# Altium project GESTUREDCONTROLCAR_PCB.PrjPcb
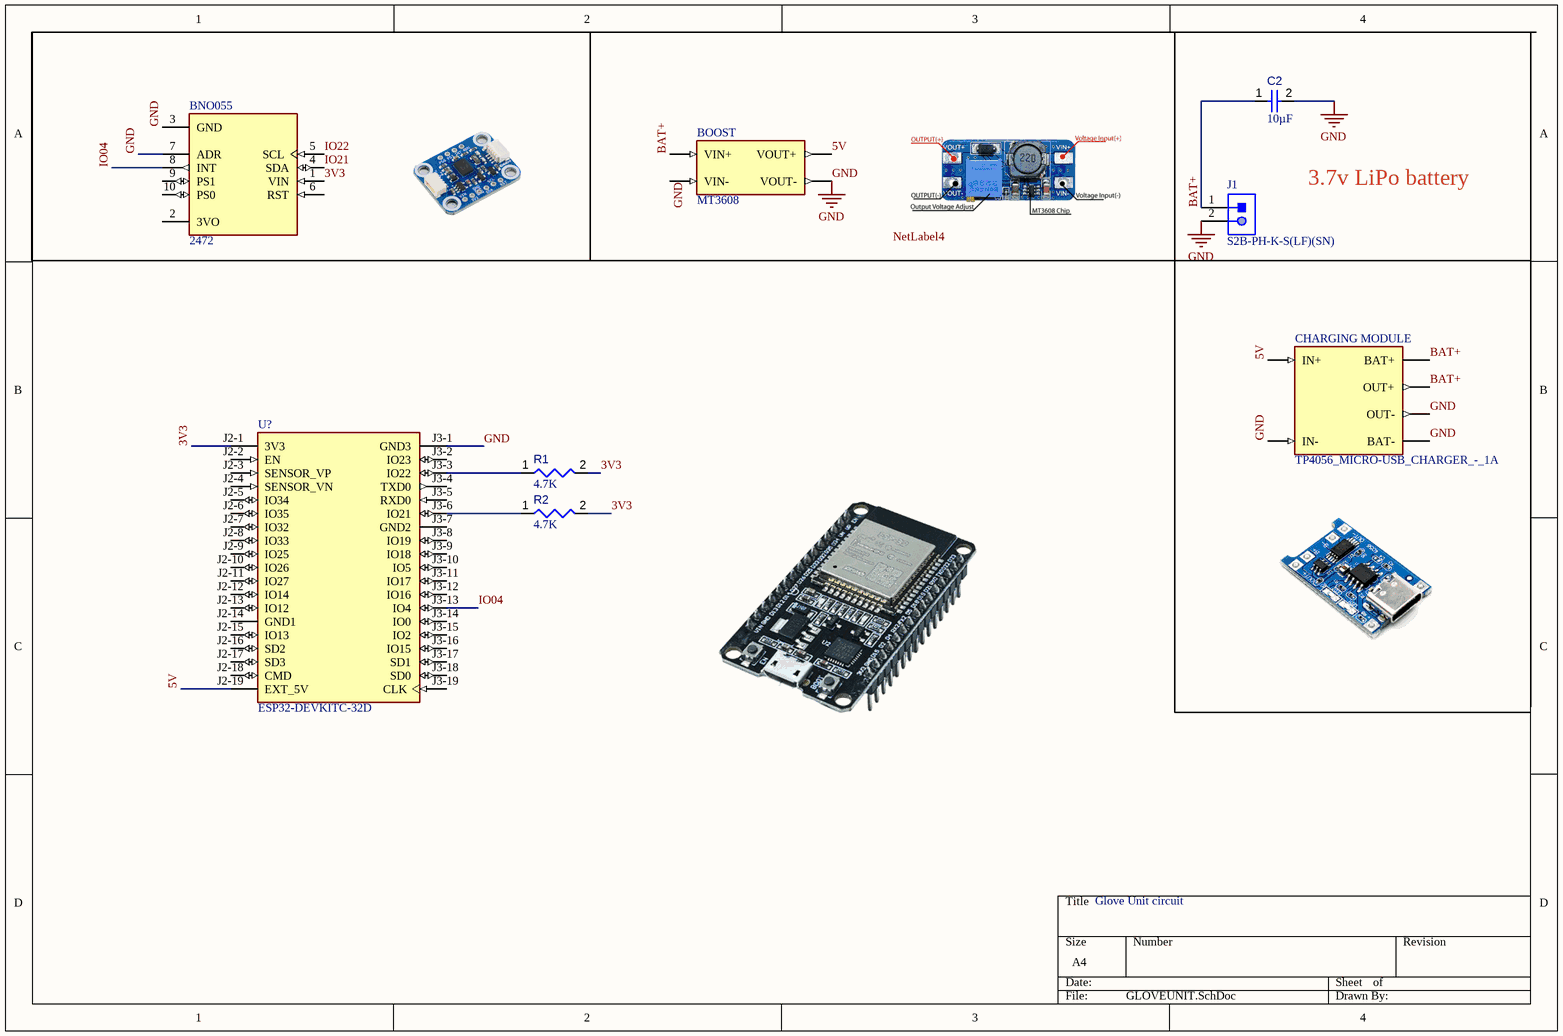
[diagram p0: GLOVEUNIT.SchDoc]
1 sheet, 8 parts. Net scope: global (net labels, ports and power ports of the same name join across sheets).
Board file: GLOVEUNIT_PCB.PcbDoc

## Sheet GLOVEUNIT.SchDoc
size A4; SheetNumber: 1; SheetTotal: 2

### Parts
BNO055  2472  [MODULE_2472]
BOOST  MT3608  [MODULE_MT3608_DC-DC_STEP_UP_CONVERTER_2A_BOOSTER_MODULE]
C2  value 10µF  [CAPC0402(1005)60_L]  (hidden comment: Capacitor 100nF +/-20% 50V 0402)
CHARGING_MODULE  TP4056_MICRO-USB_CHARGER_-_1A  [MODULE_TP4056_MICRO-USB_CHARGER_-_1A]
J1  S2B-PH-K-S(LF)(SN)  [JST-S2B-PH-K-S_V]
R1  value 4.7K  [RESC0402(1005)_L]  (hidden comment: Resistor 22K  +/-1 % 0402 63 mW)
R2  value 4.7K  [RESC0402(1005)_L]  (hidden comment: Resistor 22K  +/-1 % 0402 63 mW)
U?  ESP32-DEVKITC-32D  [MODULE_ESP32-DEVKITC-32D]

### Nets
GND: BNO055.3(GND) BNO055.7(ADR) BOOST.VIN_N(VIN-) BOOST.VOUT_N(VOUT-) C2.2 CHARGING_MODULE.BAT_N(BAT-) CHARGING_MODULE.IN_N(IN-) CHARGING_MODULE.OUT_N(OUT-) J1.2 U?.J3-1(GND3)
3V3: BNO055.1(VIN) R1.2 R2.2
5V: BOOST.VOUT_P(VOUT+) CHARGING_MODULE.IN_P(IN+) U?.J2-19(EXT_5V)
BAT+: BOOST.VIN_P(VIN+) C2.1 CHARGING_MODULE.BAT_P(BAT+) CHARGING_MODULE.OUT_P(OUT+) J1.1
IO04: BNO055.8(INT) U?.J3-13(IO4)
IO21: BNO055.4(SDA)
IO22: BNO055.5(SCL)
NetR1_1: R1.1 U?.J3-3(IO22)
NetR2_1: R2.1 U?.J3-6(IO21)

Not connected (* = marked no-connect by the designer): BNO055 2(3VO) 6(RST) 9(PS1) 10(PS0); U? J2-1(3V3) J2-2(EN) J2-3(SENSOR_VP) J2-4(SENSOR_VN) J2-5(IO34) J2-6(IO35) J2-7(IO32) J2-8(IO33) J2-9(IO25) J2-10(IO26) J2-11(IO27) J2-12(IO14) J2-13(IO12) J2-14(GND1) J2-15(IO13) J2-16(SD2) J2-17(SD3) J2-18(CMD) J3-2(IO23) J3-4(TXD0) J3-5(RXD0) J3-7(GND2) J3-8(IO19) J3-9(IO18) J3-10(IO5) J3-11(IO17) J3-12(IO16) J3-14(IO0) J3-15(IO2) J3-16(IO15) J3-17(SD1) J3-18(SD0) J3-19(CLK)

### Notes on the sheet
- 3.7v LiPo battery
- Glove Unit circuit
- Labels drawn without touching a wire or pin: 3V3, NetLabel4

### Library data of the parts
BNO055 = CMP-015-000000-1: Adafruit 9-DOF Absolute Orientation IMU Fusion Breakout - BNO055; MF: Adafruit; Package: Non-Standard Adafruit; Value: *; MP: 2472; Component Type: Standard; Check_prices: https://www.snapeda.com/parts/2472/Adafruit+Industries/view-part/?ref=eda; SnapEDA_Link: https://www.snapeda.com/parts/2472/Adafruit+Industries/view-part/?ref=snap; Design Item ID: 2472; Pin Count: 10; Source: 2472.SchLib
BOOST = CMP-013-000000-1: MT3608-based step-up converter boosts 2Vâ€“24V input to 28V with up to 93% efficiency. Suitable for devices needing higher voltage than the source.; MF: Generic; MP: MT3608 DC-DC Step Up Converter 2A Booster Module; Package: Package; SnapEDA_Link: https://www.snapeda.com/parts/MT3608%20DC-DC%20Step%20Up%20Converter%202A%20Booster%20Module/Generic/view-part/?ref=snap; Value: *; Design Item ID: MT3608_DC-DC_STEP_UP_CONVERTER_2A_BOOSTER_MODULE; Check_prices: https://www.snapeda.com/parts/MT3608%20DC-DC%20Step%20Up%20Converter%202A%20Booster%20Module/Generic/view-part/?ref=eda; Pin Count: 4; Source: MT3608_DC-DC_STEP_UP_CONVERTER_2A_BOOSTER_MODULE.SchLib; Component Type: Standard
C2 = CMP-001-00067-3: Chip Capacitor, 100nF +/-20%, 50V, 0402, Thickness 0.6 mm; Tolerance: 10%; Min Operating Temperature: -55°C; Pins: 2; Case/Package: 0402; Max Operating Temperature: 85°C; Voltage Rating: 50V; Mounting Technology: SMT
CHARGING_MODULE = CMP-017-000000-1: The TP4056ES Li-Ion micro USB charger is an improved version of the TP4056, ideal for 18650 batteries, with a micro USB connection for direct PC charging.; MF: Generic; MP: TP4056 Micro-USB Charger - 1A; Design Item ID: TP4056_MICRO-USB_CHARGER_-_1A; Package: Package; Component Type: Standard; SnapEDA_Link: https://www.snapeda.com/parts/TP4056%20Micro-USB%20Charger%20-%201A/Generic/view-part/?ref=snap; Pin Count: 6; Check_prices: https://www.snapeda.com/parts/TP4056%20Micro-USB%20Charger%20-%201A/Generic/view-part/?ref=eda; Value: *; Source: TP4056_MICRO-USB_CHARGER_-_1A.SchLib
J1 = CMP-002-00030-2: Male Header, Pitch 2 mm, 1 x 2 Position, Height 4.8 mm, Tail Length 3.4 mm, -25 to 85 degC, RoHS, Bulk; Manufacturer: Japan Solderless Terminals; Package Reference: S2B-PH-K-S; Case/Package: S2B-PH-K-S; Datasheet URL: http://www.jst-mfg.com/product/pdf/eng/ePH.pdf; RoHS Compliant: Unknown; Datasheet Version: Dec-12; Gender: Male; Min Operating Temperature: -25°C; Max Operating Temperature: 85°C; Package Description: Male Header, Pitch 2 mm, 1 x 2 Position, Height 4.8 mm, Tail Length 3.4 mm; Connector Type: Header; Mounting Technology: SM
R1 R2 = CMP-009-00123-3: Chip Resistor, 22 kOhms, +/-1 %, 63 mW, -55 to 155 degC, 0402; Power: 63mW; Tolerance: 1%; Pins: 2; Min Operating Temperature: -55°C; Max Operating Temperature: 155°C; Case/Package: 0402
U? = CMP-009-000000-1: WiFi Development Tools (802.11) ESP32 General Development Kit, ESP32-WROOM-32D on the board; MF: Espressif Systems; SnapEDA_Link: https://www.snapeda.com/parts/ESP32-DEVKITC-32D/Espressif+Systems/view-part/?ref=snap; Source: ESP32-DEVKITC-32D.SchLib; Design Item ID: ESP32-DEVKITC-32D; Component Type: Standard; Check_prices: https://www.snapeda.com/parts/ESP32-DEVKITC-32D/Espressif+Systems/view-part/?ref=eda; Value: *; Package: None; MP: ESP32-DEVKITC-32D; Pin Count: 38